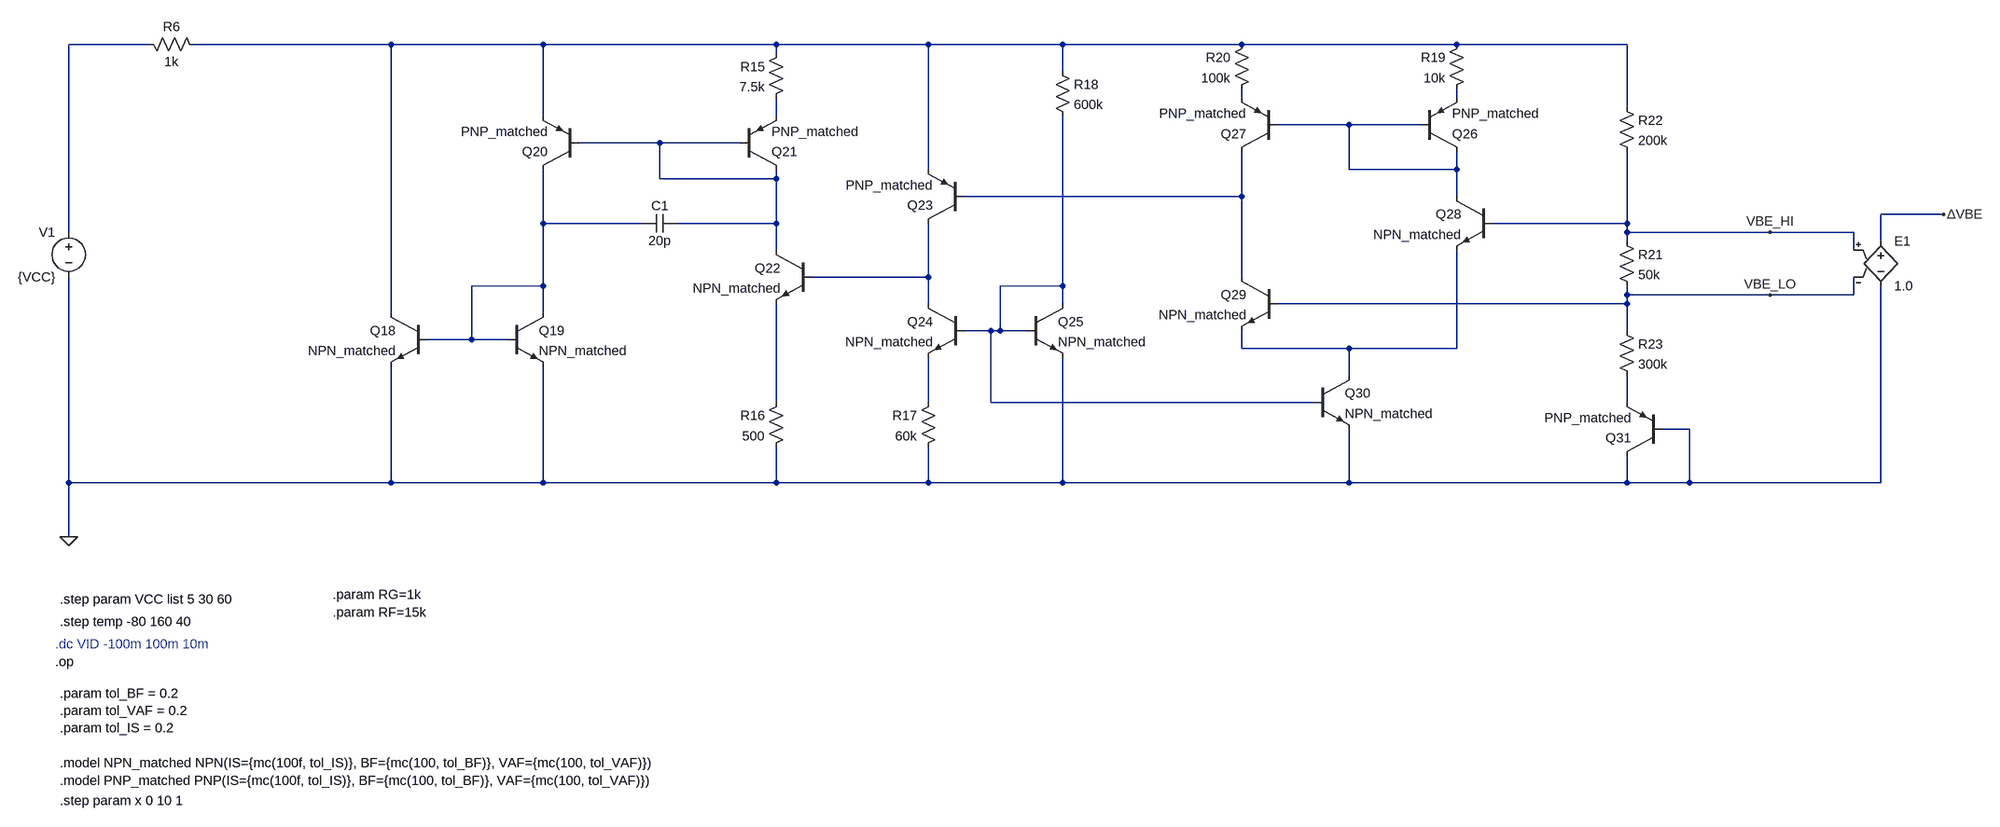
[diagram p0: schematic LM185-1p2V_Shunt_Voltage_Reference.asc]
LM185-1p2V_Shunt_Voltage_Reference.asc, the LTspice schematic file:
Version 4.1
SHEET 1 4592 1412
WIRE -528 -416 -672 -416
WIRE -96 -416 -448 -416
WIRE 176 -416 -96 -416
WIRE 592 -416 176 -416
WIRE 864 -416 592 -416
WIRE 1104 -416 864 -416
WIRE 1424 -416 1104 -416
WIRE 1808 -416 1424 -416
WIRE 2112 -416 1808 -416
WIRE 592 -400 592 -416
WIRE 1104 -368 1104 -416
WIRE 1424 -320 1424 -336
WIRE 1808 -320 1808 -336
WIRE 2112 -304 2112 -416
WIRE 176 -288 176 -416
WIRE 592 -288 592 -320
WIRE 1616 -272 1488 -272
WIRE 1744 -272 1616 -272
WIRE 384 -240 240 -240
WIRE 528 -240 384 -240
WIRE 864 -192 864 -416
WIRE 1616 -192 1616 -272
WIRE 1808 -192 1808 -224
WIRE 1808 -192 1616 -192
WIRE 384 -176 384 -240
WIRE 592 -176 592 -192
WIRE 592 -176 384 -176
WIRE 1424 -144 1424 -224
WIRE 1424 -144 928 -144
WIRE 1808 -144 1808 -192
WIRE 2736 -112 2624 -112
WIRE 176 -96 176 -192
WIRE 352 -96 176 -96
WIRE 592 -96 592 -176
WIRE 592 -96 416 -96
WIRE 2112 -96 2112 -224
WIRE 2112 -96 1872 -96
WIRE -672 -80 -672 -416
WIRE 2112 -80 2112 -96
WIRE 2368 -80 2112 -80
WIRE 2576 -80 2368 -80
WIRE 2112 -64 2112 -80
WIRE 2624 -64 2624 -112
WIRE 592 -48 592 -96
WIRE 2576 -48 2576 -80
WIRE 864 0 864 -96
WIRE 864 0 656 0
WIRE 1424 0 1424 -144
WIRE 176 16 176 -96
WIRE 176 16 48 16
WIRE 1104 16 1104 -288
WIRE 1104 16 992 16
WIRE 2112 32 2112 16
WIRE 2368 32 2112 32
WIRE 2576 32 2576 0
WIRE 2576 32 2368 32
WIRE 864 48 864 0
WIRE 1104 48 1104 16
WIRE 2112 48 2112 32
WIRE 2112 48 1488 48
WIRE -96 64 -96 -416
WIRE 176 64 176 16
WIRE 976 96 928 96
WIRE 992 96 992 16
WIRE 992 96 976 96
WIRE 1040 96 992 96
WIRE 2112 96 2112 48
WIRE 48 112 48 16
WIRE 48 112 -32 112
WIRE 112 112 48 112
WIRE 1424 128 1424 96
WIRE 1616 128 1424 128
WIRE 1808 128 1808 -48
WIRE 1808 128 1616 128
WIRE 1616 176 1616 128
WIRE 592 224 592 48
WIRE 864 224 864 144
WIRE 976 224 976 96
WIRE 1552 224 976 224
WIRE 2112 224 2112 176
WIRE 2224 272 2176 272
WIRE -672 368 -672 0
WIRE -96 368 -96 160
WIRE -96 368 -672 368
WIRE 176 368 176 160
WIRE 176 368 -96 368
WIRE 592 368 592 304
WIRE 592 368 176 368
WIRE 864 368 864 304
WIRE 864 368 592 368
WIRE 1104 368 1104 144
WIRE 1104 368 864 368
WIRE 1616 368 1616 272
WIRE 1616 368 1104 368
WIRE 2112 368 2112 320
WIRE 2112 368 1616 368
WIRE 2224 368 2224 272
WIRE 2224 368 2112 368
WIRE 2624 368 2624 16
WIRE 2624 368 2224 368
WIRE -672 464 -672 368
FLAG -672 464 0
FLAG 2368 -80 VBE_HI
FLAG 2368 32 VBE_LO
FLAG 2736 -112 ΔVBE
SYMBOL voltage -672 -96 M0
WINDOW 123 0 0 Left 0
WINDOW 39 0 0 Left 0
SYMATTR InstName V1
SYMATTR Value {VCC}
SYMBOL res -544 -432 M90
WINDOW 0 0 56 VBottom 2
WINDOW 3 32 56 VTop 2
SYMATTR InstName R6
SYMATTR Value 1k
SYMBOL npn -32 64 M0
SYMATTR InstName Q18
SYMATTR Value NPN_matched
SYMBOL npn 112 64 R0
SYMATTR InstName Q19
SYMATTR Value NPN_matched
SYMBOL pnp 240 -192 R180
SYMATTR InstName Q20
SYMATTR Value PNP_matched
SYMBOL cap 416 -112 R90
WINDOW 0 0 32 VBottom 2
WINDOW 3 32 32 VTop 2
SYMATTR InstName C1
SYMATTR Value 20p
SYMBOL pnp 528 -192 M180
SYMATTR InstName Q21
SYMATTR Value PNP_matched
SYMBOL res 608 -416 M0
SYMATTR InstName R15
SYMATTR Value 7.5k
SYMBOL npn 656 -48 M0
SYMATTR InstName Q22
SYMATTR Value NPN_matched
SYMBOL res 608 208 M0
SYMATTR InstName R16
SYMATTR Value 500
SYMBOL pnp 928 -96 R180
SYMATTR InstName Q23
SYMATTR Value PNP_matched
SYMBOL npn 928 48 M0
SYMATTR InstName Q24
SYMATTR Value NPN_matched
SYMBOL res 880 208 M0
SYMATTR InstName R17
SYMATTR Value 60k
SYMBOL npn 1040 48 R0
SYMATTR InstName Q25
SYMATTR Value NPN_matched
SYMBOL res 1088 -384 R0
SYMATTR InstName R18
SYMATTR Value 600k
SYMBOL res 1824 -432 M0
SYMATTR InstName R19
SYMATTR Value 10k
SYMBOL res 1440 -432 M0
SYMATTR InstName R20
SYMATTR Value 100k
SYMBOL pnp 1744 -224 M180
SYMATTR InstName Q26
SYMATTR Value PNP_matched
SYMBOL pnp 1488 -224 R180
SYMATTR InstName Q27
SYMATTR Value PNP_matched
SYMBOL npn 1872 -144 M0
SYMATTR InstName Q28
SYMATTR Value NPN_matched
SYMBOL npn 1488 0 M0
SYMATTR InstName Q29
SYMATTR Value NPN_matched
SYMBOL e 2624 -80 R0
SYMATTR InstName E1
SYMATTR Value 1.0
SYMBOL npn 1552 176 R0
SYMATTR InstName Q30
SYMATTR Value NPN_matched
SYMBOL res 2096 -80 R0
SYMATTR InstName R21
SYMATTR Value 50k
SYMBOL res 2096 -320 R0
SYMATTR InstName R22
SYMATTR Value 200k
SYMBOL res 2096 80 R0
SYMATTR InstName R23
SYMATTR Value 300k
SYMBOL pnp 2176 320 R180
SYMATTR InstName Q31
SYMATTR Value PNP_matched
TEXT -696 656 Left 2 ;.dc VID -100m 100m 10m
TEXT -688 616 Left 2 !.step temp -80 160 40
TEXT -688 744 Left 2 !.param tol_BF = 0.2\n.param tol_VAF = 0.2\n.param tol_IS = 0.2\n \n.model NPN_matched NPN(IS={mc(100f, tol_IS)}, BF={mc(100, tol_BF)}, VAF={mc(100, tol_VAF)})\n.model PNP_matched PNP(IS={mc(100f, tol_IS)}, BF={mc(100, tol_BF)}, VAF={mc(100, tol_VAF)})
TEXT -688 936 Left 2 !.step param x 0 10 1
TEXT -696 688 Left 2 !.op
TEXT -688 576 Left 2 !.step param VCC list 5 30 60
TEXT -200 568 Left 2 !.param RG=1k\n.param RF=15k

The netlist it stands for:
* LM185-1p2V_Shunt_Voltage_Reference.asc
V1 N001 0 {VCC}
R6 N001 N002 1k
Q18 N002 N009 0 0 NPN_matched
Q19 N009 N009 0 0 NPN_matched
Q20 N009 N007 N002 0 PNP_matched
C1 N007 N009 20p
Q21 N007 N007 N005 0 PNP_matched
R15 N002 N005 7.5k
Q22 N007 N010 N013 0 NPN_matched
R16 N013 0 500
Q23 N010 N008 N002 0 PNP_matched
Q24 N010 N011 N014 0 NPN_matched
R17 N014 0 60k
Q25 N011 N011 0 0 NPN_matched
R18 N002 N011 600k
R19 N002 N004 10k
R20 N002 N003 100k
Q26 N006 N006 N004 0 PNP_matched
Q27 N008 N006 N003 0 PNP_matched
Q28 N006 VBE_HI N012 0 NPN_matched
Q29 N008 VBE_LO N012 0 NPN_matched
E1 ΔVBE 0 VBE_HI VBE_LO 1.0
Q30 N012 N011 0 0 NPN_matched
R21 VBE_HI VBE_LO 50k
R22 N002 VBE_HI 200k
R23 VBE_LO N015 300k
Q31 0 0 N015 0 PNP_matched
.model NPN NPN
.model PNP PNP
.lib standard.bjt
* .dc VID -100m 100m 10m
.step temp -80 160 40
.param tol_BF = 0.2
.param tol_VAF = 0.2
.param tol_IS = 0.2
.model NPN_matched NPN(IS={mc(100f, tol_IS)}, BF={mc(100, tol_BF)}, VAF={mc(100, tol_VAF)})
.model PNP_matched PNP(IS={mc(100f, tol_IS)}, BF={mc(100, tol_BF)}, VAF={mc(100, tol_VAF)})
.step param x 0 10 1
.op
.step param VCC list 5 30 60
.param RG=1k
.param RF=15k
.backanno
.end